# Altium schematic sheet Connectors.SchDoc
size A; SheetNumber: 2; SheetTotal: 2
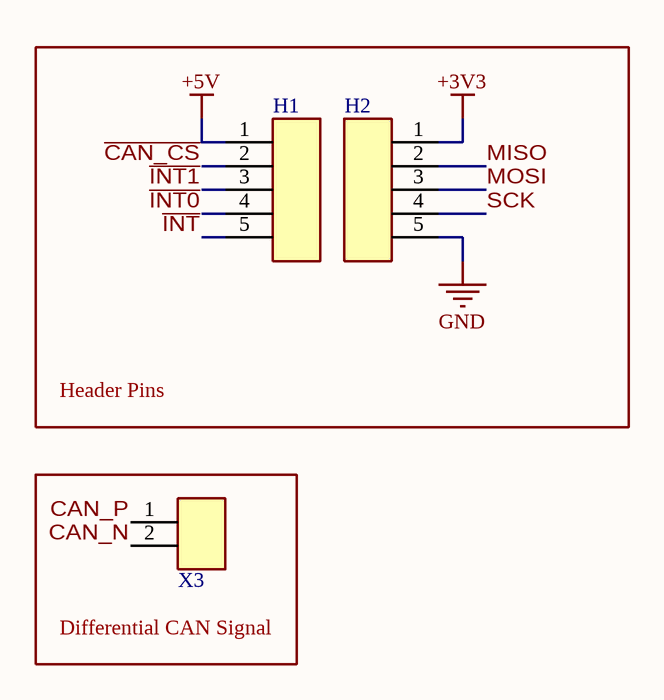
[diagram p0: Connectors.SchDoc]

## Parts
H1  1x5 Header  [[Header] 1x5 Male]  (value not drawn)
H2  1x5 Header  [[Header] 1x5 Male]  (value not drawn)
X3  2pin Screw Terminal  [[Screw Terminal] 2pin 5mm]  (value not drawn)

## Blocks framed on the sheet
Header Pins: H1 H2
Differential CAN Signal: X3

## Nets
+3V3: H2.1
+5V: H1.1
GND: H2.5
~{CAN_CS}: H1.2
~{INT}: H1.5
~{INT0}: H1.4
~{INT1}: H1.3
CAN_N: X3.2
CAN_P: X3.1
MISO: H2.2
MOSI: H2.3
SCK: H2.4

## Library data of the parts
H1 H2 = [Header] 1x5 Male: 2.54mm pitch
X3 = [Screw Terminal] 2pin: TB002-500-02BE; Supplier 1: DigiKey; Supplier Part Number 1: 102-6145-ND